# Altium project 三代电容_power_1923.PrjPcb
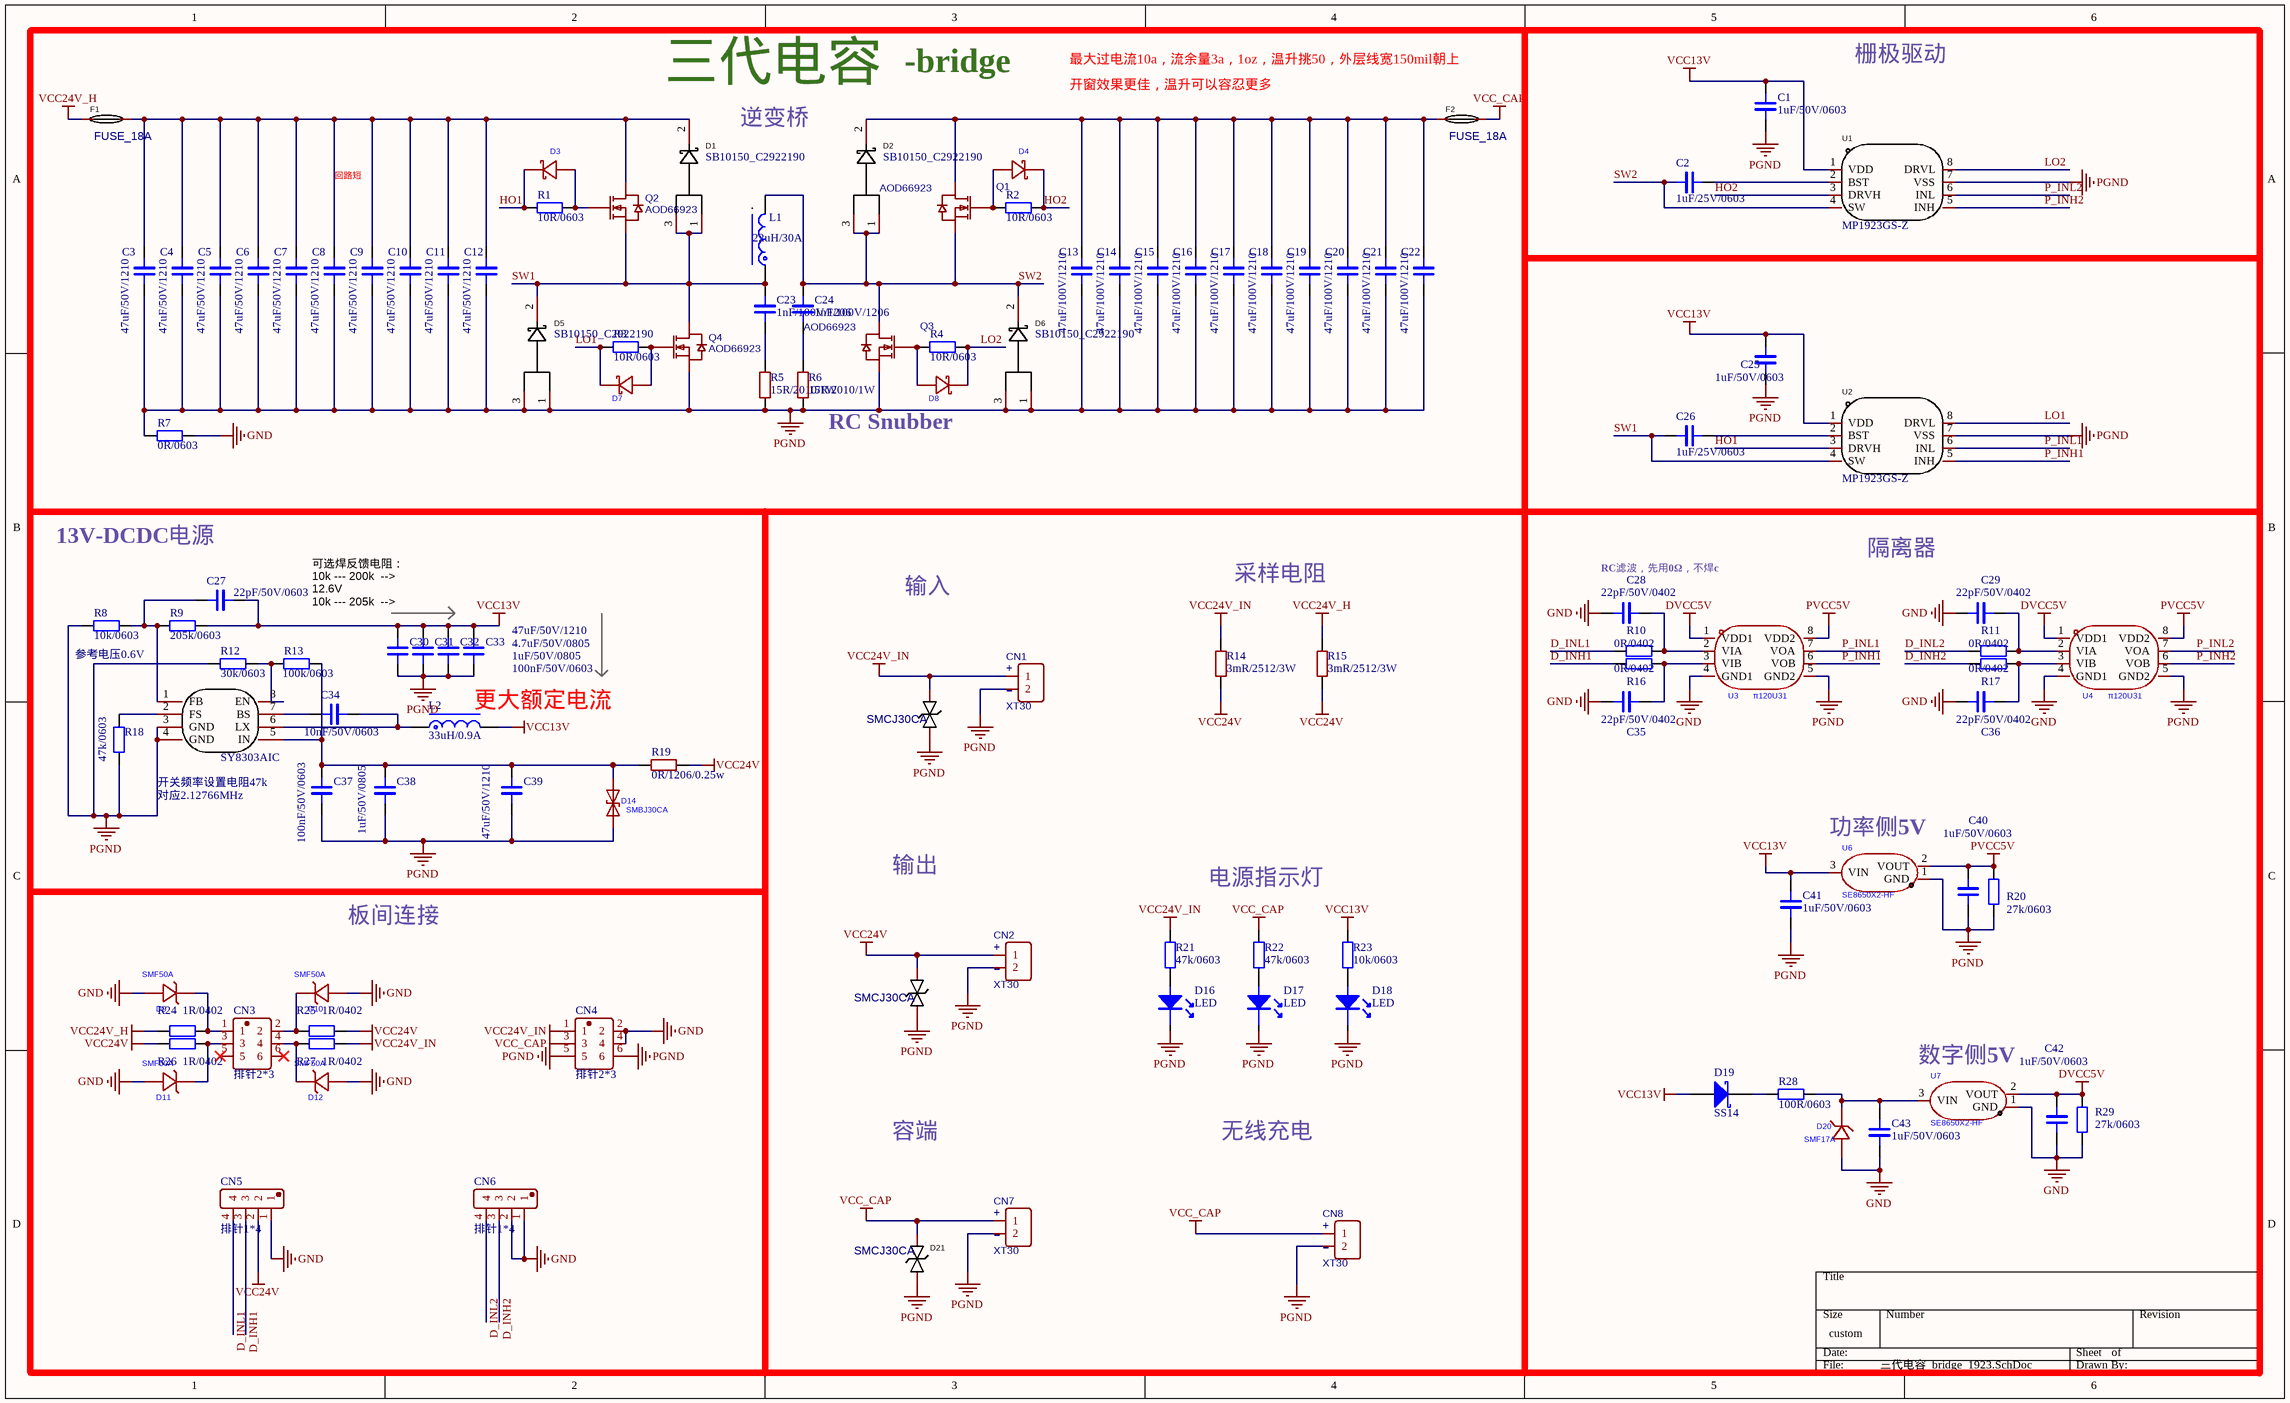
[diagram p0: 三代电容_bridge_1923.SchDoc]
1 sheet, 116 parts. Net scope: global (net labels, ports and power ports of the same name join across sheets).
Board file: 三代电容_power_1923.PcbDoc

## Sheet 三代电容_bridge_1923.SchDoc
size 457 x 279 mm

### Parts
C1  1uF/50V/0603  [C 0603_L]
C2  1uF/25V/0603  [C 0603_L]
C3  47uF/50V/1210  [C 1210_L]
C4  47uF/50V/1210  [C 1210_L]
C5  47uF/50V/1210  [C 1210_L]
C6  47uF/50V/1210  [C 1210_L]
C7  47uF/50V/1210  [C 1210_L]
C8  47uF/50V/1210  [C 1210_L]
C9  47uF/50V/1210  [C 1210_L]
C10  47uF/50V/1210  [C 1210_L]
C11  47uF/50V/1210  [C 1210_L]
C12  47uF/50V/1210  [C 1210_L]
C13  47uF/100V/1210  [C 1210_L]
C14  47uF/100V/1210  [C 1210_L]
C15  47uF/100V/1210  [C 1210_L]
C16  47uF/100V/1210  [C 1210_L]
C17  47uF/100V/1210  [C 1210_L]
C18  47uF/100V/1210  [C 1210_L]
C19  47uF/100V/1210  [C 1210_L]
C20  47uF/100V/1210  [C 1210_L]
C21  47uF/100V/1210  [C 1210_L]
C22  47uF/100V/1210  [C 1210_L]
C23  1nF/100V/1206  [C 1210_L]
C24  1nF/100V/1206  [C 1210_L]
C25  1uF/50V/0603  [C 0603_L]
C26  1uF/25V/0603  [C 0603_L]
C27  22pF/50V/0603  [C 0603_L]
C28  22pF/50V/0402  [C 0402_L]
C29  22pF/50V/0402  [C 0402_L]
C30  47uF/50V/1210  [C 1210_L]
C31  4.7uF/50V/0805  [C 0805_L]
C32  1uF/50V/0805  [C 0805_L]
C33  100nF/50V/0603  [C 0603_L]
C34  10nF/50V/0603  [C 0603_L]
C35  22pF/50V/0402  [C 0402_L]
C36  22pF/50V/0402  [C 0402_L]
C37  100nF/50V/0603  [C 0603_L]
C38  1uF/50V/0805  [C 0805_L]
C39  47uF/50V/1210  [C 1210_L]
C40  1uF/50V/0603  [C 0603_L]
C41  1uF/50V/0603  [C 0603_L]
C42  1uF/50V/0603  [C 0603_L]
C43  1uF/50V/0603  [C 0603_L]
CN1  XT30  [XT30 -WS公头]
CN2  XT30  [XT30 -WS母头]
CN3  排针2*3  [HDR2.54-LI-2x3P]
CN4  排针2*3  [HDR2.54-LI-2x3P]
CN5  排针1*4  [HDR2.54-LI-4P]
CN6  排针1*4  [HDR2.54-LI-4P]
CN7  XT30  [XT30 -WS母头]
CN8  XT30  [XT30 -WS公头]
D1  SB10150_C2922190  [TO-277_3P-L5.4-W4.0-LS6.5-TR]
D2  SB10150_C2922190  [TO-277_3P-L5.4-W4.0-LS6.5-TR]
D3  CDBVRL140-HF  [LED-SMD_L1.6-W0.8-RD-2]  (value not drawn)
D4  CDBVRL140-HF  [LED-SMD_L1.6-W0.8-RD-2]  (value not drawn)
D5  SB10150_C2922190  [TO-277_3P-L5.4-W4.0-LS6.5-TR]
D6  SB10150_C2922190  [TO-277_3P-L5.4-W4.0-LS6.5-TR]
D7  CDBVRL140-HF  [LED-SMD_L1.6-W0.8-RD-2]  (value not drawn)
D8  CDBVRL140-HF  [LED-SMD_L1.6-W0.8-RD-2]  (value not drawn)
D9  SMF50A  [SOD-123FL_L2.7-W1.8-LS3.8-RD]
D10  SMF50A  [SOD-123FL_L2.7-W1.8-LS3.8-RD]
D11  SMF50A  [SOD-123FL_L2.7-W1.8-LS3.8-RD]
D12  SMF50A  [SOD-123FL_L2.7-W1.8-LS3.8-RD]
D13  SMCJ30CA  [SMC_L6.9-W5.9-LS7.9-BI]
D14  SMBJ30CA  [SMB_L4.3-W3.6-LS5.4-BI]
D15  SMCJ30CA  [SMC_L6.9-W5.9-LS7.9-BI]
D16  LED  [LED_0603]
D17  LED  [LED_0603]
D18  LED  [LED_0603]
D19  SS14  [SOD-123]
D20  SMF17A  [SOD-123FL_L2.8-W1.8-LS3.6-RD]
D21  SMCJ30CA  [SMC_L6.9-W5.9-LS7.9-BI]
F1  FUSE_18A  [FUSE-SMD_L6.1-W2.6]
F2  FUSE_18A  [FUSE-SMD_L6.1-W2.6]
L1  22uH/30A  [PQ2918贴片式]
L2  33uH/0.9A  [IND-SMD_L4.0-W4.0]
Q1  AOD66923  [TO-252-2_L6.6-W6.1-P4.57-LS9.9-BR-CW]
Q2  AOD66923  [TO-252-2_L6.6-W6.1-P4.57-LS9.9-BR-CW]
Q3  AOD66923  [TO-252-2_L6.6-W6.1-P4.57-LS9.9-BR-CW]
Q4  AOD66923  [TO-252-2_L6.6-W6.1-P4.57-LS9.9-BR-CW]
R1  10R/0603  [R 0603_L]
R2  10R/0603  [R 0603_L]
R3  10R/0603  [R 0603_L]
R4  10R/0603  [R 0603_L]
R5  15R/2010/1W  [R 2512_L]
R6  15R/2010/1W  [R 2512_L]
R7  0R/0603  [R 0603_L]
R8  10k/0603  [R 0603_L]
R9  205k/0603  [R 0603_L]
R10  0R/0402  [R 0402_L]
R11  0R/0402  [R 0402_L]
R12  30k/0603  [R 0603_L]
R13  100k/0603  [R 0603_L]
R14  3mR/2512/3W  [R 2512_L]
R15  3mR/2512/3W  [R 2512_L]
R16  0R/0402  [R 0402_L]
R17  0R/0402  [R 0402_L]
R18  47k/0603  [R 0603_L]
R19  0R/1206/0.25w  [R 1206_L]
R20  27k/0603  [R 0603_L]
R21  47k/0603  [R 0603_L]
R22  47k/0603  [R 0603_L]
R23  10k/0603  [R 0603_L]
R24  1R/0402  [R 0402_L]
R25  1R/0402  [R 0402_L]
R26  1R/0402  [R 0402_L]
R27  1R/0402  [R 0402_L]
R28  100R/0603  [R 0603_L]
R29  27k/0603  [R 0603_L]
U1  MP1923GS-Z  [SOIC-8_L5.0-W4.0-P1.27-LS6.0-BL]
U2  MP1923GS-Z  [SOIC-8_L5.0-W4.0-P1.27-LS6.0-BL]
U3  π120U31  [SOIC-8_L5.0-W4.0-P1.27-LS6.0-BL]
U4  π120U31  [SOIC-8_L5.0-W4.0-P1.27-LS6.0-BL]
U5  SY8303AIC  [TSOT-23-8_L2.9-W1.6-P0.65-LS2.8-BR]
U6  SE8650X2-HF  [SOT-23-3_L2.9-W1.6-P1.90-LS2.8-BR]
U7  SE8650X2-HF  [SOT-23-3_L2.9-W1.6-P1.90-LS2.8-BR]

### Blocks framed on the sheet
三代电容: C3-C24 D1-D8 F1 F2 L1 Q1-Q4 R1-R7

### Nets
DVCC5V: C42.1 R29.1 U3.1(VDD1) U4.1(VDD1) U7.2(VOUT)
GND: C28.1 C29.1 C35.2 C36.2 C42.2 C43.2 CN4.2 CN4.4 CN5.1 CN6.1 CN6.2 D9.2(A) D10.2(A) D11.2(A) D12.2(A) D20.2 R7.2 R29.2 U3.4(GND1) U4.4(GND1) U7.1(GND)
PGND: C1.2 C3.2 C4.2 C5.2 C6.2 C7.2 C8.2 C9.2 C10.2 C11.2 C12.2 C13.2 C14.2 C15.2 C16.2 C17.2 C18.2 C19.2 C20.2 C21.2 C22.2 C25.2 C30.2 C31.2 C32.2 C33.2 C37.2 C38.2 C39.2 C40.2 C41.2 CN1.2 CN2.2 CN4.5 CN4.6 CN7.2 CN8.2 D5.1 D5.3 D6.1 D6.3 D13.1 D14.2(A1) D15.1 D16.2 D17.2 D18.2 D21.1 Q3.3(S) Q4.3(S) R5.2 R6.2 R7.1 R8.1 R12.1 R18.2 R20.2 U1.7(VSS) U2.7(VSS) U3.5(GND2) U4.5(GND2) U5.3(GND) U5.4(GND) U6.1(GND)
PVCC5V: C40.1 R20.1 U3.8(VDD2) U4.8(VDD2) U6.2(VOUT)
VCC13V: C1.1 C25.1 C27.1 C30.1 C31.1 C32.1 C33.1 C41.1 D19.1(A) L2.2 R9.2 R23.1 U1.1(VDD) U2.1(VDD) U6.3(VIN)
VCC24V: CN2.1 CN5.2 D15.2 R14.2 R15.2 R19.2 R25.2 R26.1
VCC24V_H: F1.1 R15.1 R24.1
VCC24V_IN: CN1.1 CN4.1 D13.2 R14.1 R21.1 R27.2
VCC_CAP: CN4.3 CN7.1 CN8.1 D21.2 F2.2 R22.1
D_INH1: CN5.3 R16.1
D_INH2: CN6.3 R17.1
D_INL1: CN5.4 R10.1
D_INL2: CN6.4 R11.1
HO1: D3.2(K) R1.1 U2.3(DRVH)
HO2: D4.2(K) R2.2 U1.3(DRVH)
LO1: D7.2(K) R3.1 U2.8(DRVL)
LO2: D8.2(K) R4.2 U1.8(DRVL)
P_INH1: U2.5(INH) U3.6(VOB)
P_INH2: U1.5(INH) U4.6(VOB)
P_INL1: U2.6(INL) U3.7(VOA)
P_INL2: U1.6(INL) U4.7(VOA)
SW1: C23.1 C26.2 D1.1 D1.3 D5.2 L1.1 Q2.3(S) Q4.2(D) U2.4(SW)
SW2: C2.1 C24.1 D2.1 D2.3 D6.2 L1.2 Q1.3(S) Q3.2(D) U1.4(SW)
NetC2_2: C2.2 U1.2(BST)
NetC3_1: C3.1 C4.1 C5.1 C6.1 C7.1 C8.1 C9.1 C10.1 C11.1 C12.1 D1.2 F1.2 Q2.2(D)
NetC13_1: C13.1 C14.1 C15.1 C16.1 C17.1 C18.1 C19.1 C20.1 C21.1 C22.1 D2.2 F2.1 Q1.2(D)
NetC23_2: C23.2 R5.1
NetC24_2: C24.2 R6.1
NetC26_1: C26.1 U2.2(BST)
NetC27_2: C27.2 R8.2 R9.1 U5.1(FB)
NetC28_2: C28.2 R10.2 U3.2(VIA)
NetC29_2: C29.2 R11.2 U4.2(VIA)
NetC34_1: C34.1 L2.1 U5.6(LX)
NetC34_2: C34.2 U5.7(BS)
NetC35_1: C35.1 R16.2 U3.3(VIB)
NetC36_1: C36.1 R17.2 U4.3(VIB)
NetC37_1: C37.1 C38.1 C39.1 D14.1(A2) R13.2 R19.1 U5.5(IN)
NetC43_1: C43.1 D20.1 R28.2 U7.3(VIN)
NetCN3_1: CN3.1 D9.1(K) R24.2
NetCN3_2: CN3.2 D10.1(K) R25.1
NetCN3_3: CN3.3 D11.1(K) R26.2
NetCN3_4: CN3.4 D12.1(K) R27.1
NetD3_1: D3.1(A) Q2.1(G) R1.2
NetD4_1: D4.1(A) Q1.1(G) R2.1
NetD7_1: D7.1(A) Q4.1(G) R3.2
NetD8_1: D8.1(A) Q3.1(G) R4.1
NetD16_1: D16.1 R21.2
NetD17_1: D17.1 R22.2
NetD18_1: D18.1 R23.2
NetD19_2: D19.2(K) R28.1
NetR12_2: R12.2 R13.1 U5.8(EN)
NetR18_1: R18.1 U5.2(FS)

Not connected (* = marked no-connect by the designer): CN3 5* 6*; L1 0

### Notes on the sheet
- -bridge
- 最大过电流10a，流余量3a，1oz，温升挑50，外层线宽150mil朝上
- 开窗效果更佳，温升可以容忍更多
- 栅极驱动
- (near D1) 逆变桥
- 回路短
- RC Snubber
- 13V-DCDC电源
- 输入
- 采样电阻
- (near C28) RC滤波，先用0Ω，不焊c
- 隔离器
- (near R8) 参考电压0.6V
- 可选焊反馈电阻：
  10k --- 200k  -->  12.6V
  10k --- 205k  -->  12.9V
  10k --- 210k  -->  13.2V
- (near L2) 更大额定电流
- 开关频率设置电阻47k
- 对应2.12766MHz
- (near U6) 功率侧5V
- 输出
- 电源指示灯
- 板间连接
- (near U7) 数字侧5V
- 容端
- 无线充电
- (in symbol XT30) +; -

### Library data of the parts
C1 C2 C25 C26 C28 C29 C35 C36 C40-C43 = CAP: 陶瓷电容Ceramic Capacitor;16V;X7R;1206
C3-C24 C27 C30-C34 C37-C39 = CAP: 陶瓷电容
CN1 CN2 CN7 CN8 = XT30: 电源端子; BOM_Manufacturer: Changzhou Amass Elec; BOM_Manufacturer Part: XT30UPB-F; nameAlias: Value; Contributor: LCSC; BOM_Supplier: LCSC; BOM_Supplier Part: C108769; spicePre: C; spiceSymbolName: XT30UPB-F
CN3 CN4 = 排针2*3: 2.54排针
CN5 CN6 = 排针1*4: 2.54排针
D1 D2 D5 D6 = SB10150_C2922190: 10A肖特基; Manufacturer: GOODWORK(固得沃克); Add into BOM: yes; Diode Configuration: 独立式; Forward Voltage (Vf@If): 900mV@10A; Reverse Voltage (Vr): 150V; Average Rectified Current (Io): 10A; Reverse Leakage Current (Ir): 20uA@150V; Symbol: SB10150_C2922190; Device: SB10150_C2922190; Supplier: LCSC; Supplier Part: C2922190; Manufacturer Part: SB10150; JLCPCB Part Class: Extended Part; LCSC Part Name: 电压:150V 电流:10A; Supplier Footprint: TO-277; Datasheet: https://atta.szlcsc.com/upload/public/pdf/source/20211009/AF8C3589B27F0CCB5AD5E667BFB17F78.pdf; Convert to PCB: yes
D3 D4 D7 D8 = CDBVRL140-HF: Manufacturer: Comchip(典琦); Add into BOM: yes; Forward Voltage (Vf@If): 550mV@700mA; Reverse Voltage (Vr): 40V; Rectified Current: 1A; Reverse Leakage Current (Ir): 50uA@40V; Symbol: CDBVRL140-HF; Device: CDBVRL140-HF; LCSC Part Name: 电压:40V 电流:1A; Supplier Part: C3758192; Manufacturer Part: CDBVRL140-HF; Supplier Footprint: 0603; JLCPCB Part Class: Extended Part; Datasheet: https://atta.szlcsc.com/upload/public/pdf/source/20240116/3D60EEEEF0718EF97C1BF0B00CBFA01B.pdf; Supplier: LCSC; Convert to PCB: yes
D9-D12 = SMF30A_C19077518: 单向 30V; Manufacturer: 宏迦橙; Manufacturer Part: SMF30A; Add into BOM: yes; Maximum Clamping Voltage: 48.4V; Peak Pulse Current (Ipp): 4.1A; Peak Pulse Power Dissipation (Ppp): 200W; Breakdown Voltage: 33.3V; Reverse Leakage Current (Ir): 1uA; Number of Lines: 单路; Type: TVS; Symbol: SMF30A_C19077518; Device: SMF30A_C19077518; LCSC Part Name: SMF30A; Supplier Part: C19077518; Supplier Footprint: SOD-123FL; JLCPCB Part Class: Extended Part; Datasheet: https://atta.szlcsc.com/upload/public/pdf/source/20241029/BBF9A11676F655A5C9D4546A153AB943.pdf; Supplier: LCSC; Convert to PCB: yes; polarity: 单向; Reverse Stand-Off Voltage (Vrwm): 30V; Operating Temperature: -55℃~+155℃
D13 D15 = SMCJ36CA: TVS 双向 26V; Manufacturer: FTR(乔光电子); Symbol: SMCJ36CA_C693507; Add into BOM: yes; Reverse Stand-Off Voltage (Vrwm): 36V; Breakdown Voltage (Min): 40V; Peak Pulse Current (Ipp)@10/1000μs: 25.9A; Maximum Clamping Voltage: 58.1V; Name: SMCJ36CA; Device: SMCJ36CA; LCSC Part Name: 双向 36V; Supplier Part: C693507; Manufacturer Part: SMCJ36CA; Supplier Footprint: SMC(DO-214AB); JLCPCB Part Class: Extended Part; Datasheet: https://atta.szlcsc.com/upload/public/pdf/source/20200701/C693507_A69D3CDD819DBFEBDB935C1CCCEED4E5.pdf; Supplier: LCSC; Convert to PCB: yes; Polarity: 双向
D14 = SMBJ30CA_C83847: Manufacturer: Littelfuse(美国力特); Add into BOM: yes; Reverse Stand-Off Voltage (Vrwm): 30V; Maximum Clamping Voltage: 48.4V; Peak Pulse Current (Ipp)@10/1000us: 12.4A; Peak Pulse Power Dissipation (Ppp)@10/1000us: 600W; Breakdown Voltage: 33.3V; Type: TVS; Symbol: SMBJ30CA_C83847; Device: SMBJ30CA_C83847; LCSC Part Name: SMBJ30CA; Supplier Part: C83847; Manufacturer Part: SMBJ30CA; Supplier Footprint: SMB(DO-214AA); JLCPCB Part Class: Extended Part; Datasheet: https://atta.szlcsc.com/upload/public/pdf/source/20190807/C409416_D98C874D944FBE9BE31A2BD6B7A21533.pdf; Supplier: LCSC; Convert to PCB: yes
D16-D18 = LED: 发光二极管
D19 = SS14: 肖特基二极管; 属性: 40V/1A; BOM名称: 肖特基二极管
D20 = SMF17A_C2857278: 17V 单向; Manufacturer: JSMSEMI(杰盛微); Add into BOM: yes; Maximum Clamping Voltage: 27.6V; Peak Pulse Current (Ipp): 7.2A; Breakdown Voltage: 18.9V; Reverse Leakage Current (Ir): 1uA; Type: TVS; Symbol: SMF17A_C2857278; Device: SMF17A_C2857278; LCSC Part Name: SMF17A; Supplier Part: C2857278; Manufacturer Part: SMF17A; Supplier Footprint: SOD-123FL; JLCPCB Part Class: Extended Part; Datasheet: https://atta.szlcsc.com/upload/public/pdf/source/20220120/4066B4D37095FB947F97BAEB950D8525.pdf; Supplier: LCSC; Convert to PCB: yes; Reverse Stand-Off Voltage (Vrwm): 17V
D21 = SMCJ54CA: TVS 双向 30V; Manufacturer: FTR(乔光电子); Name: SMCJ36CA; Symbol: SMCJ36CA_C693507; Add into BOM: yes; Reverse Stand-Off Voltage (Vrwm): 36V; Breakdown Voltage (Min): 40V; Peak Pulse Current (Ipp)@10/1000μs: 25.9A; Maximum Clamping Voltage: 58.1V; Device: SMCJ36CA; LCSC Part Name: 双向 36V; Supplier Part: C693507; Manufacturer Part: SMCJ36CA; Supplier Footprint: SMC(DO-214AB); JLCPCB Part Class: Extended Part; Datasheet: https://atta.szlcsc.com/upload/public/pdf/source/20200701/C693507_A69D3CDD819DBFEBDB935C1CCCEED4E5.pdf; Supplier: LCSC; Convert to PCB: yes; Polarity: 双向
F1 F2 = FUSE: 保险丝; Manufacturer: Littelfuse(美国力特); Name: 0451005.MRL; Add into BOM: yes; Fuse Type: 快速熔断; Current Rating: 5A; Rated Voltage(AC): 125V; Nominal Cold Resistance: 12.5mΩ; Breaking Capacity @ Rated Voltage: 50A; Melting I²t: 5.566; Symbol: 0451005.MRL; Device: 0451005.MRL; LCSC Part Name: 5A 125V 超快断; Supplier Part: C48467; Manufacturer Part: 0451005.MRL; Supplier Footprint: SMD; JLCPCB Part Class: Extended Part; Datasheet: https://atta.szlcsc.com/upload/public/pdf/source/20171109/C48467_15102201734031103760.pdf; Supplier: LCSC; Convert to PCB: yes; Product: 贴片式保险丝; Nominal Voltage Drop: -; Operating Temperature: -55°C ~ 125°C
L1 = L-FWHC: 扁平线大电流电感; BOM名称: 功率磁环电感
L2 = L-SMDP: 贴片功率电感; BOM名称: 功率电感
Q1-Q4 = AOD66923: NMOS 100V 58A; BOM_Manufacturer: Yangzhou Yangjie Elec Tech; BOM_Manufacturer Part: YJL3400A; Contributor: LCSC; BOM_Supplier: LCSC; BOM_Supplier Part: C699302; BOM_JLCPCB Part Class: Extended Part; spicePre: Q; spiceSymbolName: YJL3400A
R1-R4 R7-R13 R16-R18 R20-R29 = RES: 贴片电阻
R5 R6 R14 R15 R19 = RES_P: 功率电阻
U1 U2 = MP1923GS-Z: Manufacturer: SCT(芯洲科技); Symbol: SCT2450STER; Add into BOM: yes; Device: SCT2450STER; LCSC Part Name: 电源IC; Supplier Part: C509400; Manufacturer Part: SCT2450STER; Supplier Footprint: ESOP-8; JLCPCB Part Class: Extended Part; Datasheet: https://atta.szlcsc.com/upload/public/pdf/source/20200407/C509400_EDF779A672A59398CFBA9E95FA584FEC.pdf; Supplier: LCSC; Convert to PCB: yes
U3 U4 = π120U31: 隔离器; Manufacturer: 2Pai Semi(荣湃); Add into BOM: yes; Number of Forward Channels: 2; Number of Reverse Channels: 0; Data Rate(Max): 150Kbps; Isolation Voltage(Vrms): 3000; Symbol: π120U31; Device: π120U31; LCSC Part Name: 增强型ESD 3.0kVrms/6.0kVrms 150Kbps双通道数字隔离器; Supplier Part: C471588; Manufacturer Part: π120U31; Supplier Footprint: SOIC-8; JLCPCB Part Class: Extended Part; Datasheet: https://atta.szlcsc.com/upload/public/pdf/source/20191223/C471588_CD8CD4905F4DCC0F3407249B7C47B378.pdf; Supplier: LCSC; Convert to PCB: yes
U5 = SY8303AIC: DCDC ADJ 3A; Manufacturer: 矽力杰silergy; Add into BOM: yes; Function: 降压型; Name: SY8303AIC; Symbol: SY8303AIC; Device: SY8303AIC; LCSC Part Name: 降压型; Supplier Part: C97054; Manufacturer Part: SY8303AIC; Supplier Footprint: TSOT-23-8; JLCPCB Part Class: Extended Part; Datasheet: https://atta.szlcsc.com/upload/public/pdf/source/20170308/1488958431714.pdf; Supplier: LCSC; Convert to PCB: yes; Synchronous Rectification: -; Number of Outputs: -; Topology: -; Input Voltage: -; Output Current (Max): -; Switching Frequency: -
U6 U7 = SE8650X2-HF: 5V_LDO; Manufacturer: SEAWARD(思旺); Add into BOM: yes; Output Type: 固定; Voltage - Supply: 80V; Output Voltage: 5V; Voltage Dropout: 700mV@(100mA); standby current: 2uA; Output Configuration: 正极; Number of Outputs: 1; Symbol: SE8650X2-HF; Device: SE8650X2-HF; LCSC Part Name: 输入80V 输出5V 200mA; Supplier Part: C496615; Manufacturer Part: SE8650X2-HF; Supplier Footprint: SOT-23; JLCPCB Part Class: Extended Part; Datasheet: https://atta.szlcsc.com/upload/public/pdf/source/20231204/E5912244F6D9E24D718D6BDA01187AC7.pdf; Supplier: LCSC; Convert to PCB: yes; Output Current: -; Power Supply Rejection Ratio (PSRR): -; Features: 短路保护(SCP)；低ESR；热关断(TSD)；带使能